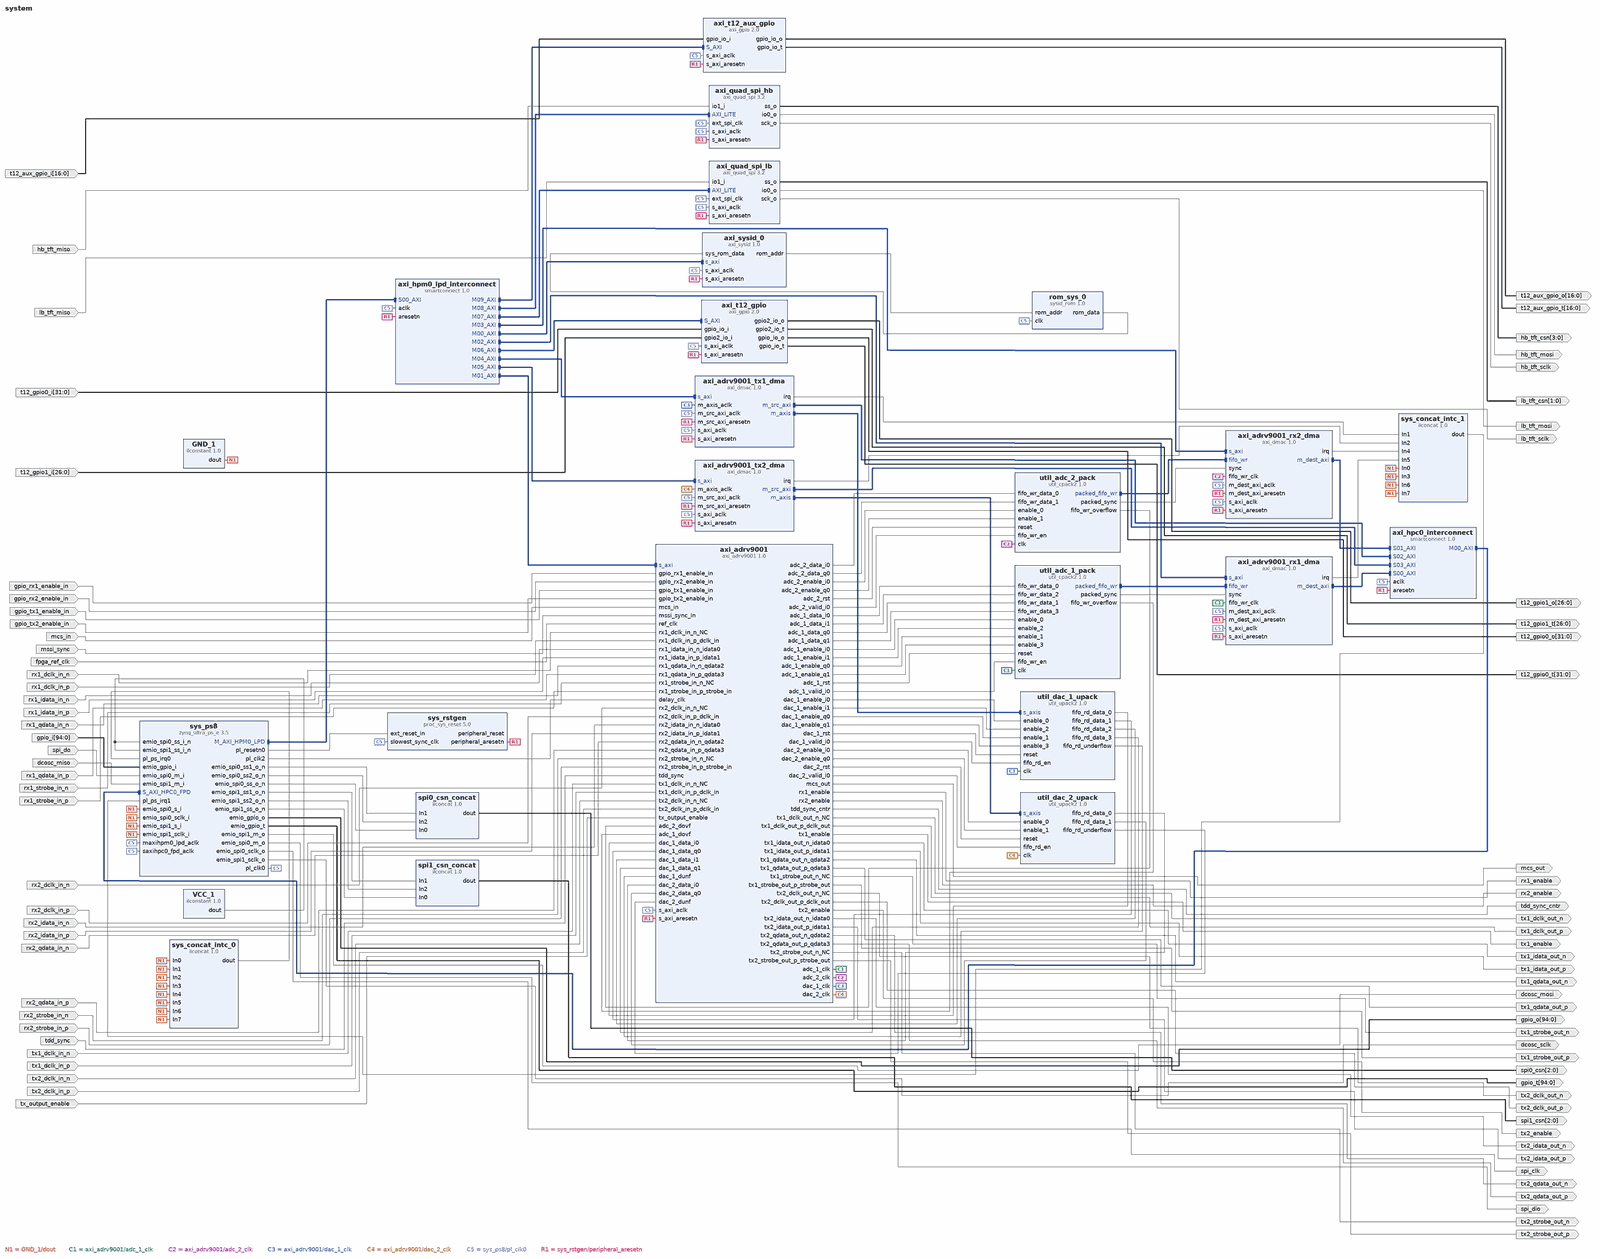
[diagram p0: block diagram of the top level, whole]
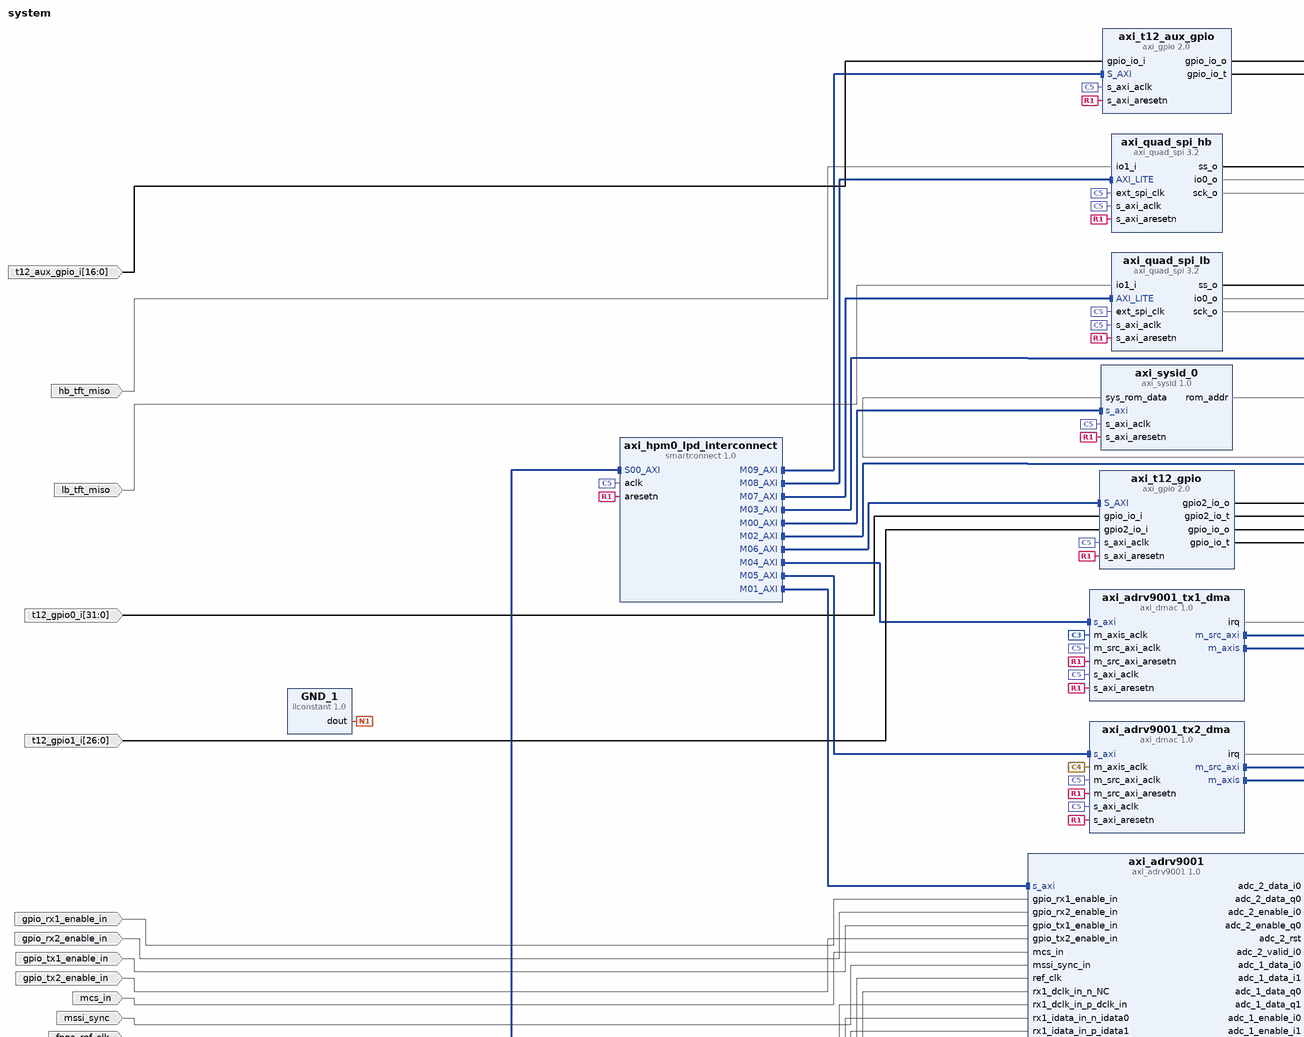
[diagram p1: block diagram of the top level, upper left part]
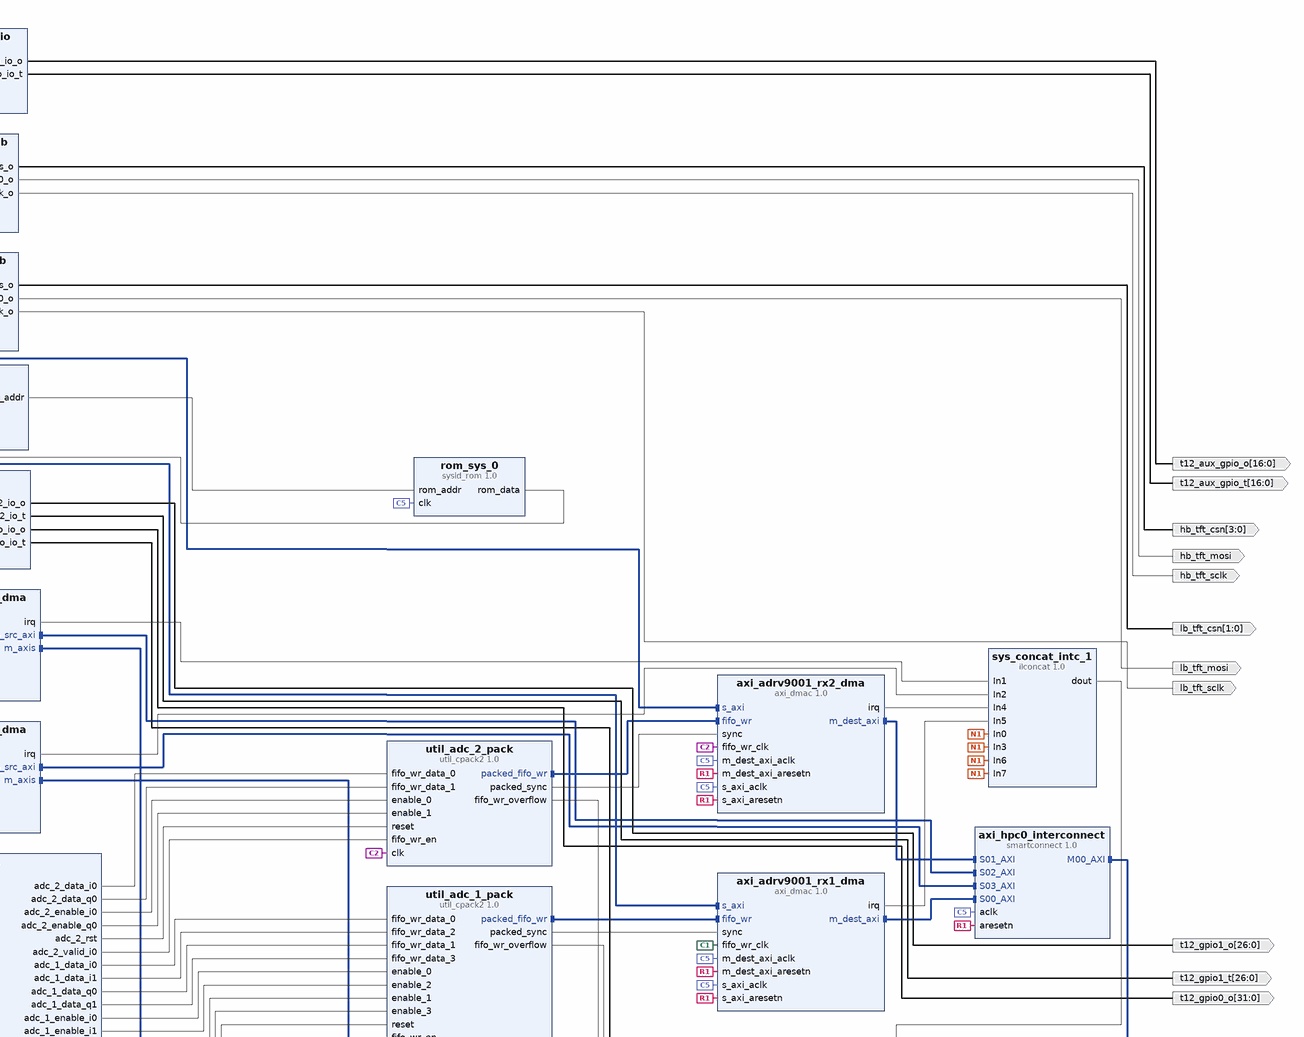
[diagram p2: block diagram of the top level, upper right part]
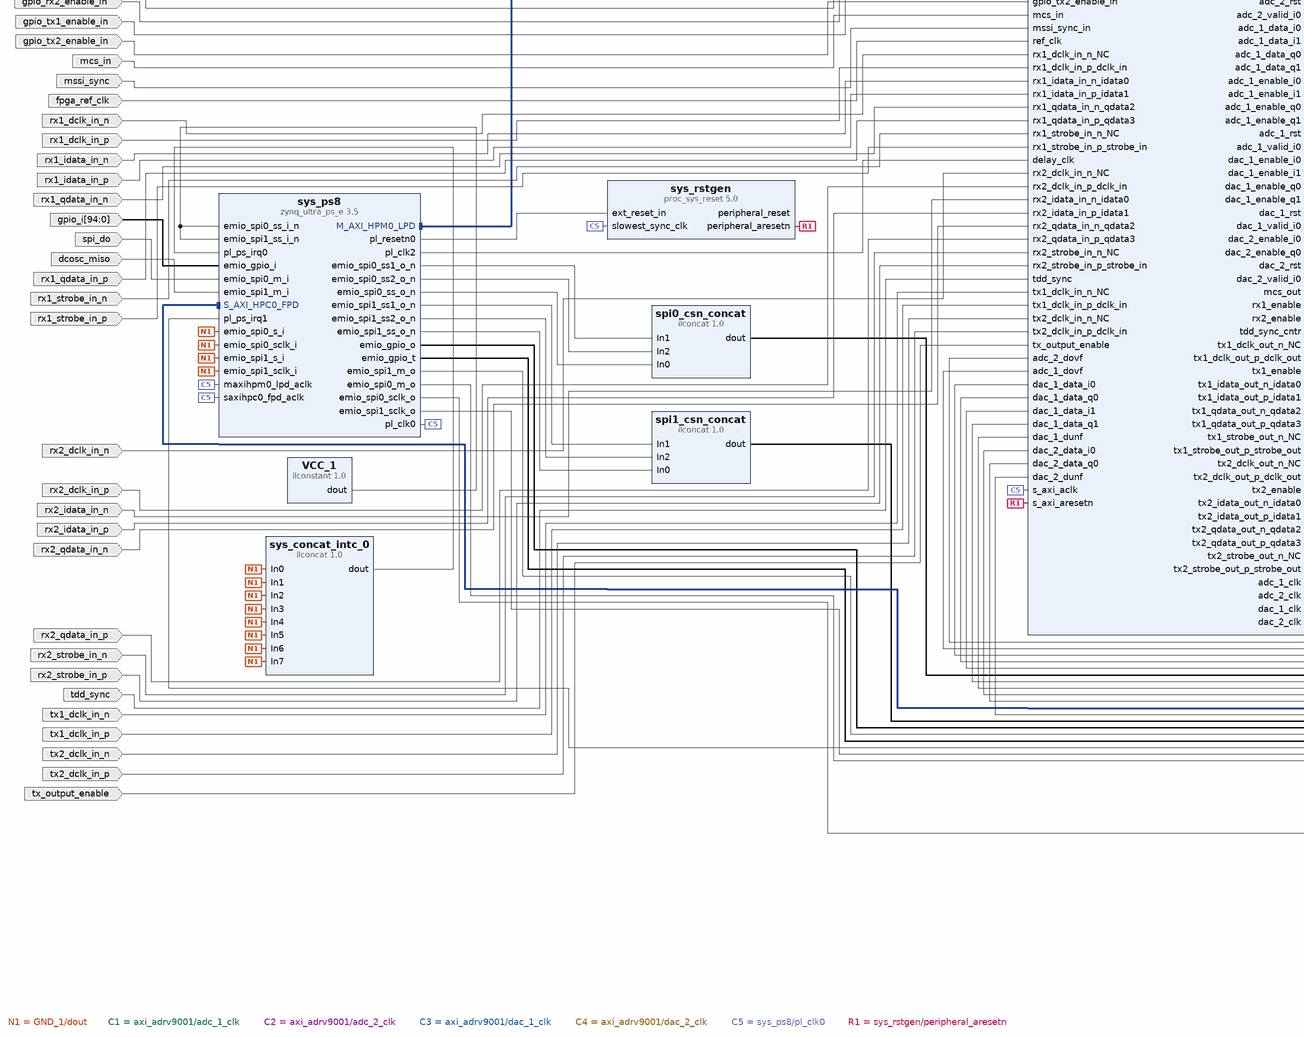
[diagram p3: block diagram of the top level, lower left part]
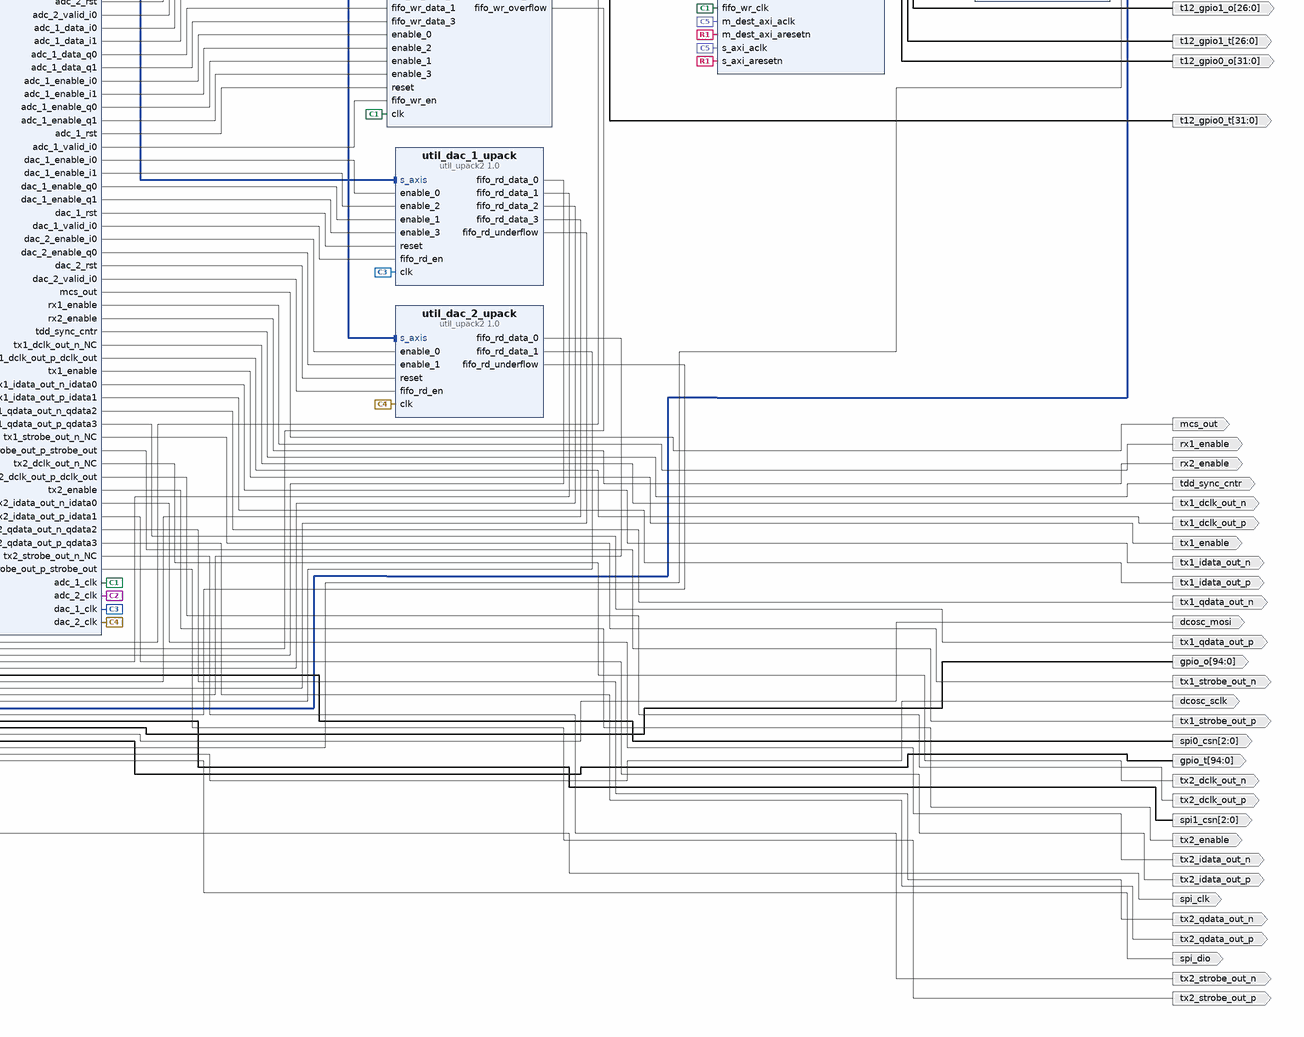
[diagram p4: block diagram of the top level, lower right part]
# Vivado block design system, xczu15eg-ffvb1156-2-i, Vivado 2024.1
create_bd_design system

create_bd_port -dir O -from 2 -to 0 spi0_csn
create_bd_port -dir O spi_clk
create_bd_port -dir O spi_dio
create_bd_port -dir I spi_do
create_bd_port -dir O -from 2 -to 0 spi1_csn
create_bd_port -dir O dcosc_sclk
create_bd_port -dir O dcosc_mosi
create_bd_port -dir I dcosc_miso
create_bd_port -dir I -from 16 -to 0 t12_aux_gpio_i
create_bd_port -dir O -from 16 -to 0 t12_aux_gpio_o
create_bd_port -dir O -from 16 -to 0 t12_aux_gpio_t
create_bd_port -dir O lb_tft_sclk
create_bd_port -dir O lb_tft_mosi
create_bd_port -dir I lb_tft_miso
create_bd_port -dir O -from 1 -to 0 lb_tft_csn
create_bd_port -dir O hb_tft_sclk
create_bd_port -dir O hb_tft_mosi
create_bd_port -dir I hb_tft_miso
create_bd_port -dir O -from 3 -to 0 hb_tft_csn
create_bd_port -dir I -from 94 -to 0 gpio_i
create_bd_port -dir O -from 94 -to 0 gpio_o
create_bd_port -dir O -from 94 -to 0 gpio_t
create_bd_port -dir I tx_output_enable
create_bd_port -dir I fpga_ref_clk
create_bd_port -dir I mcs_in
create_bd_port -dir O mcs_out
create_bd_port -dir I mssi_sync
create_bd_port -dir I rx1_dclk_in_n
create_bd_port -dir I rx1_dclk_in_p
create_bd_port -dir I rx1_idata_in_n
create_bd_port -dir I rx1_idata_in_p
create_bd_port -dir I rx1_qdata_in_n
create_bd_port -dir I rx1_qdata_in_p
create_bd_port -dir I rx1_strobe_in_n
create_bd_port -dir I rx1_strobe_in_p
create_bd_port -dir I rx2_dclk_in_n
create_bd_port -dir I rx2_dclk_in_p
create_bd_port -dir I rx2_idata_in_n
create_bd_port -dir I rx2_idata_in_p
create_bd_port -dir I rx2_qdata_in_n
create_bd_port -dir I rx2_qdata_in_p
create_bd_port -dir I rx2_strobe_in_n
create_bd_port -dir I rx2_strobe_in_p
create_bd_port -dir O tx1_dclk_out_n
create_bd_port -dir O tx1_dclk_out_p
create_bd_port -dir I tx1_dclk_in_n
create_bd_port -dir I tx1_dclk_in_p
create_bd_port -dir O tx1_idata_out_n
create_bd_port -dir O tx1_idata_out_p
create_bd_port -dir O tx1_qdata_out_n
create_bd_port -dir O tx1_qdata_out_p
create_bd_port -dir O tx1_strobe_out_n
create_bd_port -dir O tx1_strobe_out_p
create_bd_port -dir O tx2_dclk_out_n
create_bd_port -dir O tx2_dclk_out_p
create_bd_port -dir I tx2_dclk_in_n
create_bd_port -dir I tx2_dclk_in_p
create_bd_port -dir O tx2_idata_out_n
create_bd_port -dir O tx2_idata_out_p
create_bd_port -dir O tx2_qdata_out_n
create_bd_port -dir O tx2_qdata_out_p
create_bd_port -dir O tx2_strobe_out_n
create_bd_port -dir O tx2_strobe_out_p
create_bd_port -dir O rx1_enable
create_bd_port -dir O rx2_enable
create_bd_port -dir O tx1_enable
create_bd_port -dir O tx2_enable
create_bd_port -dir I gpio_rx1_enable_in
create_bd_port -dir I gpio_rx2_enable_in
create_bd_port -dir I gpio_tx1_enable_in
create_bd_port -dir I gpio_tx2_enable_in
create_bd_port -dir I tdd_sync
create_bd_port -dir O tdd_sync_cntr
create_bd_port -dir I -from 31 -to 0 t12_gpio0_i
create_bd_port -dir O -from 31 -to 0 t12_gpio0_o
create_bd_port -dir O -from 31 -to 0 t12_gpio0_t
create_bd_port -dir I -from 26 -to 0 t12_gpio1_i
create_bd_port -dir O -from 26 -to 0 t12_gpio1_o
create_bd_port -dir O -from 26 -to 0 t12_gpio1_t

create_bd_cell -type ip -vlnv xilinx.com:ip:zynq_ultra_ps_e:3.5 sys_ps8
set_property -dict [list \
  CONFIG.PSU_BANK_0_IO_STANDARD LVCMOS33 \
  CONFIG.PSU_BANK_1_IO_STANDARD LVCMOS33 \
  CONFIG.PSU_BANK_2_IO_STANDARD LVCMOS33 \
  CONFIG.PSU_BANK_3_IO_STANDARD LVCMOS33 \
  CONFIG.PSU_USB3__DUAL_CLOCK_ENABLE 0 \
  CONFIG.PSU__AFI0_COHERENCY 1 \
  CONFIG.PSU__CAN1__PERIPHERAL__ENABLE 0 \
  CONFIG.PSU__CRF_APB__ACPU_CTRL__FREQMHZ 1200 \
  CONFIG.PSU__CRF_APB__ACPU_CTRL__SRCSEL APLL \
  CONFIG.PSU__CRF_APB__APLL_CTRL__SRCSEL PSS_REF_CLK \
  CONFIG.PSU__CRF_APB__DBG_FPD_CTRL__FREQMHZ 250 \
  CONFIG.PSU__CRF_APB__DBG_FPD_CTRL__SRCSEL IOPLL \
  CONFIG.PSU__CRF_APB__DBG_TRACE_CTRL__FREQMHZ 250 \
  CONFIG.PSU__CRF_APB__DBG_TRACE_CTRL__SRCSEL IOPLL \
  CONFIG.PSU__CRF_APB__DBG_TSTMP_CTRL__FREQMHZ 250 \
  CONFIG.PSU__CRF_APB__DBG_TSTMP_CTRL__SRCSEL IOPLL \
  CONFIG.PSU__CRF_APB__DDR_CTRL__FREQMHZ 1200 \
  CONFIG.PSU__CRF_APB__DDR_CTRL__SRCSEL VPLL \
  CONFIG.PSU__CRF_APB__DPDMA_REF_CTRL__FREQMHZ 600 \
  CONFIG.PSU__CRF_APB__DPDMA_REF_CTRL__SRCSEL APLL \
  CONFIG.PSU__CRF_APB__DPLL_CTRL__SRCSEL PSS_REF_CLK \
  CONFIG.PSU__CRF_APB__DP_AUDIO_REF_CTRL__SRCSEL RPLL \
  CONFIG.PSU__CRF_APB__DP_STC_REF_CTRL__SRCSEL RPLL \
  CONFIG.PSU__CRF_APB__DP_VIDEO_REF_CTRL__SRCSEL VPLL \
  CONFIG.PSU__CRF_APB__GDMA_REF_CTRL__FREQMHZ 600 \
  CONFIG.PSU__CRF_APB__GDMA_REF_CTRL__SRCSEL APLL \
  CONFIG.PSU__CRF_APB__GPU_REF_CTRL__FREQMHZ 500 \
  CONFIG.PSU__CRF_APB__GPU_REF_CTRL__SRCSEL IOPLL \
  CONFIG.PSU__CRF_APB__TOPSW_LSBUS_CTRL__FREQMHZ 100 \
  CONFIG.PSU__CRF_APB__TOPSW_LSBUS_CTRL__SRCSEL IOPLL \
  CONFIG.PSU__CRF_APB__TOPSW_MAIN_CTRL__FREQMHZ 533.33 \
  CONFIG.PSU__CRF_APB__TOPSW_MAIN_CTRL__SRCSEL DPLL \
  CONFIG.PSU__CRF_APB__VPLL_CTRL__SRCSEL PSS_REF_CLK \
  CONFIG.PSU__CRL_APB__ADMA_REF_CTRL__FREQMHZ 500 \
  CONFIG.PSU__CRL_APB__ADMA_REF_CTRL__SRCSEL IOPLL \
  CONFIG.PSU__CRL_APB__CAN1_REF_CTRL__FREQMHZ 100 \
  CONFIG.PSU__CRL_APB__CAN1_REF_CTRL__SRCSEL IOPLL \
  CONFIG.PSU__CRL_APB__CPU_R5_CTRL__FREQMHZ 500 \
  CONFIG.PSU__CRL_APB__CPU_R5_CTRL__SRCSEL IOPLL \
  CONFIG.PSU__CRL_APB__DBG_LPD_CTRL__FREQMHZ 250 \
  CONFIG.PSU__CRL_APB__DBG_LPD_CTRL__SRCSEL IOPLL \
  CONFIG.PSU__CRL_APB__GEM3_REF_CTRL__FREQMHZ 125 \
  CONFIG.PSU__CRL_APB__GEM3_REF_CTRL__SRCSEL IOPLL \
  CONFIG.PSU__CRL_APB__I2C0_REF_CTRL__FREQMHZ 100 \
  CONFIG.PSU__CRL_APB__I2C0_REF_CTRL__SRCSEL IOPLL \
  CONFIG.PSU__CRL_APB__I2C1_REF_CTRL__FREQMHZ 100 \
  CONFIG.PSU__CRL_APB__I2C1_REF_CTRL__SRCSEL IOPLL \
  CONFIG.PSU__CRL_APB__IOPLL_CTRL__SRCSEL PSS_REF_CLK \
  CONFIG.PSU__CRL_APB__IOU_SWITCH_CTRL__FREQMHZ 250 \
  CONFIG.PSU__CRL_APB__IOU_SWITCH_CTRL__SRCSEL IOPLL \
  CONFIG.PSU__CRL_APB__LPD_LSBUS_CTRL__FREQMHZ 100 \
  CONFIG.PSU__CRL_APB__LPD_LSBUS_CTRL__SRCSEL IOPLL \
  CONFIG.PSU__CRL_APB__LPD_SWITCH_CTRL__FREQMHZ 500 \
  CONFIG.PSU__CRL_APB__LPD_SWITCH_CTRL__SRCSEL IOPLL \
  CONFIG.PSU__CRL_APB__PCAP_CTRL__FREQMHZ 200 \
  CONFIG.PSU__CRL_APB__PCAP_CTRL__SRCSEL IOPLL \
  CONFIG.PSU__CRL_APB__PL0_REF_CTRL__FREQMHZ 100 \
  CONFIG.PSU__CRL_APB__PL0_REF_CTRL__SRCSEL IOPLL \
  CONFIG.PSU__CRL_APB__PL1_REF_CTRL__FREQMHZ 250 \
  CONFIG.PSU__CRL_APB__PL1_REF_CTRL__SRCSEL IOPLL \
  CONFIG.PSU__CRL_APB__PL2_REF_CTRL__FREQMHZ 500 \
  CONFIG.PSU__CRL_APB__PL2_REF_CTRL__SRCSEL IOPLL \
  CONFIG.PSU__CRL_APB__QSPI_REF_CTRL__FREQMHZ 125 \
  CONFIG.PSU__CRL_APB__QSPI_REF_CTRL__SRCSEL IOPLL \
  CONFIG.PSU__CRL_APB__RPLL_CTRL__SRCSEL PSS_REF_CLK \
  CONFIG.PSU__CRL_APB__SDIO1_REF_CTRL__FREQMHZ 200 \
  CONFIG.PSU__CRL_APB__SDIO1_REF_CTRL__SRCSEL IOPLL \
  CONFIG.PSU__CRL_APB__SPI0_REF_CTRL__FREQMHZ 100 \
  CONFIG.PSU__CRL_APB__SPI1_REF_CTRL__FREQMHZ 100 \
  CONFIG.PSU__CRL_APB__TIMESTAMP_REF_CTRL__FREQMHZ 100 \
  CONFIG.PSU__CRL_APB__TIMESTAMP_REF_CTRL__SRCSEL IOPLL \
  CONFIG.PSU__CRL_APB__UART0_REF_CTRL__FREQMHZ 100 \
  CONFIG.PSU__CRL_APB__UART0_REF_CTRL__SRCSEL IOPLL \
  CONFIG.PSU__CRL_APB__UART1_REF_CTRL__FREQMHZ 100 \
  CONFIG.PSU__CRL_APB__UART1_REF_CTRL__SRCSEL IOPLL \
  CONFIG.PSU__CRL_APB__USB0_BUS_REF_CTRL__FREQMHZ 250 \
  CONFIG.PSU__CRL_APB__USB0_BUS_REF_CTRL__SRCSEL IOPLL \
  CONFIG.PSU__CRL_APB__USB3_DUAL_REF_CTRL__FREQMHZ 20 \
  CONFIG.PSU__CRL_APB__USB3_DUAL_REF_CTRL__SRCSEL IOPLL \
  CONFIG.PSU__CRL_APB__USB3__ENABLE 0 \
  CONFIG.PSU__CSUPMU__PERIPHERAL__VALID 1 \
  CONFIG.PSU__DDRC__BUS_WIDTH {32 Bit} \
  CONFIG.PSU__DDRC__COMPONENTS Components \
  CONFIG.PSU__DDRC__DEVICE_CAPACITY {8192 MBits} \
  CONFIG.PSU__DDRC__DRAM_WIDTH {16 Bits} \
  CONFIG.PSU__DDRC__ECC Disabled \
  CONFIG.PSU__DDRC__MEMORY_TYPE {DDR 4} \
  CONFIG.PSU__DDRC__SPEED_BIN DDR4_2400T \
  CONFIG.PSU__DDR_HIGH_ADDRESS_GUI_ENABLE 0 \
  CONFIG.PSU__DDR__INTERFACE__FREQMHZ 600.000 \
  CONFIG.PSU__DISPLAYPORT__PERIPHERAL__ENABLE 0 \
  CONFIG.PSU__DLL__ISUSED 0 \
  CONFIG.PSU__ENET3__FIFO__ENABLE 0 \
  CONFIG.PSU__ENET3__GRP_MDIO__ENABLE 1 \
  CONFIG.PSU__ENET3__GRP_MDIO__IO {MIO 76 .. 77} \
  CONFIG.PSU__ENET3__PERIPHERAL__ENABLE 1 \
  CONFIG.PSU__ENET3__PERIPHERAL__IO {MIO 64 .. 75} \
  CONFIG.PSU__ENET3__PTP__ENABLE 0 \
  CONFIG.PSU__ENET3__TSU__ENABLE 0 \
  CONFIG.PSU__FPGA_PL0_ENABLE 1 \
  CONFIG.PSU__FPGA_PL1_ENABLE 1 \
  CONFIG.PSU__FPGA_PL2_ENABLE 1 \
  CONFIG.PSU__GEM3_COHERENCY 0 \
  CONFIG.PSU__GEM3_ROUTE_THROUGH_FPD 0 \
  CONFIG.PSU__GEM__TSU__ENABLE 0 \
  CONFIG.PSU__GPIO0_MIO__IO {MIO 0 .. 25} \
  CONFIG.PSU__GPIO0_MIO__PERIPHERAL__ENABLE 1 \
  CONFIG.PSU__GPIO1_MIO__IO {MIO 26 .. 51} \
  CONFIG.PSU__GPIO1_MIO__PERIPHERAL__ENABLE 1 \
  CONFIG.PSU__GPIO_EMIO_WIDTH 95 \
  CONFIG.PSU__GPIO_EMIO__PERIPHERAL__ENABLE 1 \
  CONFIG.PSU__GPIO_EMIO__PERIPHERAL__IO 95 \
  CONFIG.PSU__I2C0__PERIPHERAL__ENABLE 1 \
  CONFIG.PSU__I2C0__PERIPHERAL__IO {MIO 42 .. 43} \
  CONFIG.PSU__I2C1__PERIPHERAL__ENABLE 0 \
  CONFIG.PSU__IOU_SLCR__IOU_TTC_APB_CLK__TTC0_SEL APB \
  CONFIG.PSU__IOU_SLCR__IOU_TTC_APB_CLK__TTC1_SEL APB \
  CONFIG.PSU__IOU_SLCR__IOU_TTC_APB_CLK__TTC2_SEL APB \
  CONFIG.PSU__IOU_SLCR__IOU_TTC_APB_CLK__TTC3_SEL APB \
  CONFIG.PSU__OVERRIDE__BASIC_CLOCK 0 \
  CONFIG.PSU__PCIE__CLASS_CODE_BASE 0x06 \
  CONFIG.PSU__PCIE__CLASS_CODE_INTERFACE 0x0 \
  CONFIG.PSU__PCIE__CLASS_CODE_SUB 0x4 \
  CONFIG.PSU__PCIE__DEVICE_ID 0xD021 \
  CONFIG.PSU__PCIE__REVISION_ID 0x0 \
  CONFIG.PSU__PCIE__SUBSYSTEM_ID 0x7 \
  CONFIG.PSU__PCIE__SUBSYSTEM_VENDOR_ID 0x10EE \
  CONFIG.PSU__PCIE__VENDOR_ID 0x10EE \
  CONFIG.PSU__PMU_COHERENCY 0 \
  CONFIG.PSU__PMU__AIBACK__ENABLE 0 \
  CONFIG.PSU__PMU__EMIO_GPI__ENABLE 0 \
  CONFIG.PSU__PMU__EMIO_GPO__ENABLE 0 \
  CONFIG.PSU__PMU__GPI0__ENABLE 0 \
  CONFIG.PSU__PMU__GPI1__ENABLE 0 \
  CONFIG.PSU__PMU__GPI2__ENABLE 0 \
  CONFIG.PSU__PMU__GPI3__ENABLE 0 \
  CONFIG.PSU__PMU__GPI4__ENABLE 0 \
  CONFIG.PSU__PMU__GPI5__ENABLE 0 \
  CONFIG.PSU__PMU__GPO0__ENABLE 1 \
  CONFIG.PSU__PMU__GPO0__IO {MIO 32} \
  CONFIG.PSU__PMU__GPO1__ENABLE 1 \
  CONFIG.PSU__PMU__GPO1__IO {MIO 33} \
  CONFIG.PSU__PMU__GPO2__ENABLE 0 \
  CONFIG.PSU__PMU__GPO3__ENABLE 0 \
  CONFIG.PSU__PMU__GPO4__ENABLE 0 \
  CONFIG.PSU__PMU__GPO5__ENABLE 1 \
  CONFIG.PSU__PMU__GPO5__IO {MIO 37} \
  CONFIG.PSU__PMU__GPO5__POLARITY low \
  CONFIG.PSU__PMU__PERIPHERAL__ENABLE 1 \
  CONFIG.PSU__PMU__PLERROR__ENABLE 0 \
  CONFIG.PSU__PRESET_APPLIED 1 \
  CONFIG.PSU__PSS_REF_CLK__FREQMHZ 33.333333333 \
  CONFIG.PSU__QSPI_COHERENCY 0 \
  CONFIG.PSU__QSPI_ROUTE_THROUGH_FPD 0 \
  CONFIG.PSU__QSPI__GRP_FBCLK__ENABLE 0 \
  CONFIG.PSU__QSPI__PERIPHERAL__DATA_MODE x4 \
  CONFIG.PSU__QSPI__PERIPHERAL__ENABLE 1 \
  CONFIG.PSU__QSPI__PERIPHERAL__IO {MIO 0 .. 5} \
  CONFIG.PSU__QSPI__PERIPHERAL__MODE Single \
  CONFIG.PSU__SATA__PERIPHERAL__ENABLE 0 \
  CONFIG.PSU__SD1__CLK_100_SDR_OTAP_DLY 0x3 \
  CONFIG.PSU__SD1__CLK_200_SDR_OTAP_DLY 0x3 \
  CONFIG.PSU__SD1__CLK_50_DDR_ITAP_DLY 0x3D \
  CONFIG.PSU__SD1__CLK_50_DDR_OTAP_DLY 0x4 \
  CONFIG.PSU__SD1__CLK_50_SDR_ITAP_DLY 0x15 \
  CONFIG.PSU__SD1__CLK_50_SDR_OTAP_DLY 0x5 \
  CONFIG.PSU__SD1__PERIPHERAL__ENABLE 0 \
  CONFIG.PSU__SPI0__GRP_SS0__IO EMIO \
  CONFIG.PSU__SPI0__GRP_SS1__ENABLE 1 \
  CONFIG.PSU__SPI0__GRP_SS1__IO EMIO \
  CONFIG.PSU__SPI0__GRP_SS2__ENABLE 1 \
  CONFIG.PSU__SPI0__GRP_SS2__IO EMIO \
  CONFIG.PSU__SPI0__PERIPHERAL__ENABLE 1 \
  CONFIG.PSU__SPI0__PERIPHERAL__IO EMIO \
  CONFIG.PSU__SPI1__GRP_SS0__IO EMIO \
  CONFIG.PSU__SPI1__GRP_SS1__ENABLE 1 \
  CONFIG.PSU__SPI1__GRP_SS1__IO EMIO \
  CONFIG.PSU__SPI1__GRP_SS2__ENABLE 1 \
  CONFIG.PSU__SPI1__GRP_SS2__IO EMIO \
  CONFIG.PSU__SPI1__PERIPHERAL__ENABLE 1 \
  CONFIG.PSU__SPI1__PERIPHERAL__IO EMIO \
  CONFIG.PSU__SWDT0__CLOCK__ENABLE 0 \
  CONFIG.PSU__SWDT0__PERIPHERAL__ENABLE 1 \
  CONFIG.PSU__SWDT0__RESET__ENABLE 0 \
  CONFIG.PSU__SWDT1__CLOCK__ENABLE 0 \
  CONFIG.PSU__SWDT1__PERIPHERAL__ENABLE 1 \
  CONFIG.PSU__SWDT1__RESET__ENABLE 0 \
  CONFIG.PSU__TSU__BUFG_PORT_PAIR 0 \
  CONFIG.PSU__TTC0__CLOCK__ENABLE 0 \
  CONFIG.PSU__TTC0__PERIPHERAL__ENABLE 1 \
  CONFIG.PSU__TTC0__WAVEOUT__ENABLE 0 \
  CONFIG.PSU__TTC1__CLOCK__ENABLE 0 \
  CONFIG.PSU__TTC1__PERIPHERAL__ENABLE 1 \
  CONFIG.PSU__TTC1__WAVEOUT__ENABLE 0 \
  CONFIG.PSU__TTC2__CLOCK__ENABLE 0 \
  CONFIG.PSU__TTC2__PERIPHERAL__ENABLE 1 \
  CONFIG.PSU__TTC2__WAVEOUT__ENABLE 0 \
  CONFIG.PSU__TTC3__CLOCK__ENABLE 0 \
  CONFIG.PSU__TTC3__PERIPHERAL__ENABLE 1 \
  CONFIG.PSU__TTC3__WAVEOUT__ENABLE 0 \
  CONFIG.PSU__UART0__BAUD_RATE 115200 \
  CONFIG.PSU__UART0__MODEM__ENABLE 0 \
  CONFIG.PSU__UART0__PERIPHERAL__ENABLE 1 \
  CONFIG.PSU__UART0__PERIPHERAL__IO {MIO 26 .. 27} \
  CONFIG.PSU__UART1__PERIPHERAL__ENABLE 0 \
  CONFIG.PSU__USB0__PERIPHERAL__ENABLE 0 \
  CONFIG.PSU__USE__IRQ0 1 \
  CONFIG.PSU__USE__IRQ1 1 \
  CONFIG.PSU__USE__M_AXI_GP0 0 \
  CONFIG.PSU__USE__M_AXI_GP1 0 \
  CONFIG.PSU__USE__M_AXI_GP2 1 \
  CONFIG.PSU__USE__S_AXI_GP0 1 \
] [get_bd_cells sys_ps8]
# 188 more settings of sys_ps8 are not shown: defaults, MIO pin electricals, DDR timing, and values the tool derives
create_bd_cell -type ip -vlnv xilinx.com:ip:proc_sys_reset:5.0 sys_rstgen
set_property -dict {CONFIG.C_EXT_RST_WIDTH 1} [get_bd_cells sys_rstgen]
create_bd_cell -type inline_hdl -vlnv xilinx.com:inline_hdl:ilconcat:1.0 spi0_csn_concat
set_property -dict {CONFIG.NUM_PORTS 3} [get_bd_cells spi0_csn_concat]
create_bd_cell -type inline_hdl -vlnv xilinx.com:inline_hdl:ilconstant:1.0 VCC_1
set_property -dict {CONFIG.CONST_VAL 1 CONFIG.CONST_WIDTH 1} [get_bd_cells VCC_1]
create_bd_cell -type inline_hdl -vlnv xilinx.com:inline_hdl:ilconstant:1.0 GND_1
set_property -dict {CONFIG.CONST_VAL 0 CONFIG.CONST_WIDTH 1} [get_bd_cells GND_1]
create_bd_cell -type inline_hdl -vlnv xilinx.com:inline_hdl:ilconcat:1.0 spi1_csn_concat
set_property -dict {CONFIG.NUM_PORTS 3} [get_bd_cells spi1_csn_concat]
create_bd_cell -type ip -vlnv analog.com:user:axi_sysid:1.0 axi_sysid_0
set_property -dict {CONFIG.ROM_ADDR_BITS 9} [get_bd_cells axi_sysid_0]
create_bd_cell -type ip -vlnv analog.com:user:sysid_rom:1.0 rom_sys_0
set_property -dict [list \
  CONFIG.PATH_TO_FILE /home/taokhe/Projects/in/msdr/msdr_gen/mem_init_sys.txt \
  CONFIG.ROM_ADDR_BITS 9 \
] [get_bd_cells rom_sys_0]
create_bd_cell -type ip -vlnv xilinx.com:ip:smartconnect:1.0 axi_hpm0_lpd_interconnect
set_property -dict {CONFIG.NUM_MI 10 CONFIG.NUM_SI 1} [get_bd_cells axi_hpm0_lpd_interconnect]
create_bd_cell -type inline_hdl -vlnv xilinx.com:inline_hdl:ilconcat:1.0 sys_concat_intc_0
set_property -dict {CONFIG.NUM_PORTS 8} [get_bd_cells sys_concat_intc_0]
create_bd_cell -type inline_hdl -vlnv xilinx.com:inline_hdl:ilconcat:1.0 sys_concat_intc_1
set_property -dict {CONFIG.NUM_PORTS 8} [get_bd_cells sys_concat_intc_1]
create_bd_cell -type ip -vlnv analog.com:user:axi_adrv9001:1.0 axi_adrv9001
set_property -dict {CONFIG.CMOS_LVDS_N 0 CONFIG.USE_RX_CLK_FOR_TX1 2 CONFIG.USE_RX_CLK_FOR_TX2 2} [get_bd_cells axi_adrv9001]
create_bd_cell -type ip -vlnv analog.com:user:axi_dmac:1.0 axi_adrv9001_rx1_dma
set_property -dict [list \
  CONFIG.ALLOW_ASYM_MEM 1 \
  CONFIG.AXI_SLICE_DEST false \
  CONFIG.AXI_SLICE_SRC false \
  CONFIG.CACHE_COHERENT true \
  CONFIG.CYCLIC false \
  CONFIG.DMA_2D_TRANSFER false \
  CONFIG.DMA_DATA_WIDTH_SRC 64 \
  CONFIG.DMA_TYPE_DEST 0 \
  CONFIG.DMA_TYPE_SRC 2 \
  CONFIG.SYNC_TRANSFER_START true \
] [get_bd_cells axi_adrv9001_rx1_dma]
create_bd_cell -type ip -vlnv analog.com:user:util_cpack2:1.0 util_adc_1_pack
set_property -dict {CONFIG.NUM_OF_CHANNELS 4 CONFIG.SAMPLE_DATA_WIDTH 16} [get_bd_cells util_adc_1_pack]
create_bd_cell -type ip -vlnv analog.com:user:axi_dmac:1.0 axi_adrv9001_rx2_dma
set_property -dict [list \
  CONFIG.ALLOW_ASYM_MEM 1 \
  CONFIG.AXI_SLICE_DEST false \
  CONFIG.AXI_SLICE_SRC false \
  CONFIG.CACHE_COHERENT true \
  CONFIG.CYCLIC false \
  CONFIG.DMA_2D_TRANSFER false \
  CONFIG.DMA_DATA_WIDTH_SRC 32 \
  CONFIG.DMA_TYPE_DEST 0 \
  CONFIG.DMA_TYPE_SRC 2 \
  CONFIG.SYNC_TRANSFER_START true \
] [get_bd_cells axi_adrv9001_rx2_dma]
create_bd_cell -type ip -vlnv analog.com:user:util_cpack2:1.0 util_adc_2_pack
set_property -dict {CONFIG.NUM_OF_CHANNELS 2 CONFIG.SAMPLE_DATA_WIDTH 16} [get_bd_cells util_adc_2_pack]
create_bd_cell -type ip -vlnv analog.com:user:axi_dmac:1.0 axi_adrv9001_tx1_dma
set_property -dict [list \
  CONFIG.ALLOW_ASYM_MEM 1 \
  CONFIG.AXI_SLICE_DEST false \
  CONFIG.AXI_SLICE_SRC false \
  CONFIG.CACHE_COHERENT true \
  CONFIG.CYCLIC true \
  CONFIG.DMA_2D_TRANSFER false \
  CONFIG.DMA_DATA_WIDTH_DEST 64 \
  CONFIG.DMA_TYPE_DEST 1 \
  CONFIG.DMA_TYPE_SRC 0 \
  CONFIG.SYNC_TRANSFER_START false \
] [get_bd_cells axi_adrv9001_tx1_dma]
create_bd_cell -type ip -vlnv analog.com:user:util_upack2:1.0 util_dac_1_upack
set_property -dict {CONFIG.NUM_OF_CHANNELS 4 CONFIG.SAMPLE_DATA_WIDTH 16} [get_bd_cells util_dac_1_upack]
create_bd_cell -type ip -vlnv analog.com:user:axi_dmac:1.0 axi_adrv9001_tx2_dma
set_property -dict [list \
  CONFIG.ALLOW_ASYM_MEM 1 \
  CONFIG.AXI_SLICE_DEST false \
  CONFIG.AXI_SLICE_SRC false \
  CONFIG.CACHE_COHERENT true \
  CONFIG.CYCLIC true \
  CONFIG.DMA_2D_TRANSFER false \
  CONFIG.DMA_DATA_WIDTH_DEST 32 \
  CONFIG.DMA_TYPE_DEST 1 \
  CONFIG.DMA_TYPE_SRC 0 \
  CONFIG.SYNC_TRANSFER_START false \
] [get_bd_cells axi_adrv9001_tx2_dma]
create_bd_cell -type ip -vlnv analog.com:user:util_upack2:1.0 util_dac_2_upack
set_property -dict {CONFIG.NUM_OF_CHANNELS 2 CONFIG.SAMPLE_DATA_WIDTH 16} [get_bd_cells util_dac_2_upack]
create_bd_cell -type ip -vlnv xilinx.com:ip:smartconnect:1.0 axi_hpc0_interconnect
set_property -dict {CONFIG.NUM_MI 1 CONFIG.NUM_SI 4} [get_bd_cells axi_hpc0_interconnect]
create_bd_cell -type ip -vlnv xilinx.com:ip:axi_gpio:2.0 axi_t12_gpio
set_property -dict [list \
  CONFIG.C_ALL_INPUTS 0 \
  CONFIG.C_ALL_INPUTS_2 0 \
  CONFIG.C_ALL_OUTPUTS 0 \
  CONFIG.C_ALL_OUTPUTS_2 0 \
  CONFIG.C_DOUT_DEFAULT 0x00000000 \
  CONFIG.C_DOUT_DEFAULT_2 0x00000000 \
  CONFIG.C_GPIO2_WIDTH 27 \
  CONFIG.C_GPIO_WIDTH 32 \
  CONFIG.C_INTERRUPT_PRESENT 0 \
  CONFIG.C_IS_DUAL 1 \
  CONFIG.C_TRI_DEFAULT 0xFFFFFFFF \
  CONFIG.C_TRI_DEFAULT_2 0xFFFFFFFF \
] [get_bd_cells axi_t12_gpio]
create_bd_cell -type ip -vlnv xilinx.com:ip:axi_gpio:2.0 axi_t12_aux_gpio
set_property -dict [list \
  CONFIG.C_ALL_INPUTS 0 \
  CONFIG.C_ALL_OUTPUTS 0 \
  CONFIG.C_DOUT_DEFAULT 0x00000000 \
  CONFIG.C_GPIO_WIDTH 17 \
  CONFIG.C_INTERRUPT_PRESENT 0 \
  CONFIG.C_TRI_DEFAULT 0x0001FFFF \
] [get_bd_cells axi_t12_aux_gpio]
create_bd_cell -type ip -vlnv xilinx.com:ip:axi_quad_spi:3.2 axi_quad_spi_lb
set_property -dict [list \
  CONFIG.C_FIFO_DEPTH 16 \
  CONFIG.C_NUM_SS_BITS 2 \
  CONFIG.C_NUM_TRANSFER_BITS 8 \
  CONFIG.C_SCK_RATIO 16 \
  CONFIG.C_SPI_MODE 0 \
  CONFIG.C_USE_STARTUP 0 \
  CONFIG.FIFO_INCLUDED 1 \
  CONFIG.Master_mode 1 \
] [get_bd_cells axi_quad_spi_lb]
create_bd_cell -type ip -vlnv xilinx.com:ip:axi_quad_spi:3.2 axi_quad_spi_hb
set_property -dict [list \
  CONFIG.C_FIFO_DEPTH 16 \
  CONFIG.C_NUM_SS_BITS 4 \
  CONFIG.C_NUM_TRANSFER_BITS 8 \
  CONFIG.C_SCK_RATIO 16 \
  CONFIG.C_SPI_MODE 0 \
  CONFIG.C_USE_STARTUP 0 \
  CONFIG.FIFO_INCLUDED 1 \
  CONFIG.Master_mode 1 \
] [get_bd_cells axi_quad_spi_hb]

# ---- connections ----

connect_bd_intf_net [get_bd_intf_pins axi_hpc0_interconnect/S00_AXI] [get_bd_intf_pins axi_adrv9001_rx1_dma/m_dest_axi]
connect_bd_intf_net [get_bd_intf_pins axi_hpc0_interconnect/S01_AXI] [get_bd_intf_pins axi_adrv9001_rx2_dma/m_dest_axi]
connect_bd_intf_net [get_bd_intf_pins axi_adrv9001_tx1_dma/m_axis] [get_bd_intf_pins util_dac_1_upack/s_axis]
connect_bd_intf_net [get_bd_intf_pins axi_hpc0_interconnect/S02_AXI] [get_bd_intf_pins axi_adrv9001_tx1_dma/m_src_axi]
connect_bd_intf_net [get_bd_intf_pins axi_adrv9001_tx2_dma/m_axis] [get_bd_intf_pins util_dac_2_upack/s_axis]
connect_bd_intf_net [get_bd_intf_pins axi_hpc0_interconnect/S03_AXI] [get_bd_intf_pins axi_adrv9001_tx2_dma/m_src_axi]
connect_bd_intf_net [get_bd_intf_pins axi_hpc0_interconnect/M00_AXI] [get_bd_intf_pins sys_ps8/S_AXI_HPC0_FPD]
connect_bd_intf_net [get_bd_intf_pins axi_hpm0_lpd_interconnect/M00_AXI] [get_bd_intf_pins axi_sysid_0/s_axi]
connect_bd_intf_net [get_bd_intf_pins axi_hpm0_lpd_interconnect/M01_AXI] [get_bd_intf_pins axi_adrv9001/s_axi]
connect_bd_intf_net [get_bd_intf_pins axi_hpm0_lpd_interconnect/M02_AXI] [get_bd_intf_pins axi_adrv9001_rx1_dma/s_axi]
connect_bd_intf_net [get_bd_intf_pins axi_hpm0_lpd_interconnect/M03_AXI] [get_bd_intf_pins axi_adrv9001_rx2_dma/s_axi]
connect_bd_intf_net [get_bd_intf_pins axi_hpm0_lpd_interconnect/M04_AXI] [get_bd_intf_pins axi_adrv9001_tx1_dma/s_axi]
connect_bd_intf_net [get_bd_intf_pins axi_hpm0_lpd_interconnect/M05_AXI] [get_bd_intf_pins axi_adrv9001_tx2_dma/s_axi]
connect_bd_intf_net [get_bd_intf_pins axi_hpm0_lpd_interconnect/M06_AXI] [get_bd_intf_pins axi_t12_gpio/S_AXI]
connect_bd_intf_net [get_bd_intf_pins axi_hpm0_lpd_interconnect/M07_AXI] [get_bd_intf_pins axi_quad_spi_lb/AXI_LITE]
connect_bd_intf_net [get_bd_intf_pins axi_hpm0_lpd_interconnect/M08_AXI] [get_bd_intf_pins axi_quad_spi_hb/AXI_LITE]
connect_bd_intf_net [get_bd_intf_pins axi_hpm0_lpd_interconnect/M09_AXI] [get_bd_intf_pins axi_t12_aux_gpio/S_AXI]
connect_bd_intf_net [get_bd_intf_pins axi_hpm0_lpd_interconnect/S00_AXI] [get_bd_intf_pins sys_ps8/M_AXI_HPM0_LPD]
connect_bd_intf_net [get_bd_intf_pins util_adc_1_pack/packed_fifo_wr] [get_bd_intf_pins axi_adrv9001_rx1_dma/fifo_wr]
connect_bd_intf_net [get_bd_intf_pins util_adc_2_pack/packed_fifo_wr] [get_bd_intf_pins axi_adrv9001_rx2_dma/fifo_wr]
connect_bd_net [get_bd_pins GND_1/dout] \
  [get_bd_pins sys_concat_intc_1/In7] [get_bd_pins sys_concat_intc_1/In6] [get_bd_pins sys_concat_intc_1/In3] \
  [get_bd_pins sys_concat_intc_1/In0] [get_bd_pins sys_concat_intc_0/In7] [get_bd_pins sys_concat_intc_0/In6] \
  [get_bd_pins sys_concat_intc_0/In5] [get_bd_pins sys_concat_intc_0/In4] [get_bd_pins sys_concat_intc_0/In3] \
  [get_bd_pins sys_concat_intc_0/In2] [get_bd_pins sys_concat_intc_0/In1] [get_bd_pins sys_concat_intc_0/In0] \
  [get_bd_pins sys_ps8/emio_spi0_sclk_i] [get_bd_pins sys_ps8/emio_spi0_s_i] [get_bd_pins sys_ps8/emio_spi1_sclk_i] \
  [get_bd_pins sys_ps8/emio_spi1_s_i]
connect_bd_net [get_bd_pins VCC_1/dout] [get_bd_pins sys_ps8/emio_spi0_ss_i_n] [get_bd_pins sys_ps8/emio_spi1_ss_i_n]
connect_bd_net [get_bd_pins axi_adrv9001/adc_1_clk] [get_bd_pins axi_adrv9001_rx1_dma/fifo_wr_clk] [get_bd_pins util_adc_1_pack/clk]
connect_bd_net [get_bd_pins axi_adrv9001/adc_1_data_i0] [get_bd_pins util_adc_1_pack/fifo_wr_data_0]
connect_bd_net [get_bd_pins axi_adrv9001/adc_1_data_i1] [get_bd_pins util_adc_1_pack/fifo_wr_data_2]
connect_bd_net [get_bd_pins axi_adrv9001/adc_1_data_q0] [get_bd_pins util_adc_1_pack/fifo_wr_data_1]
connect_bd_net [get_bd_pins axi_adrv9001/adc_1_data_q1] [get_bd_pins util_adc_1_pack/fifo_wr_data_3]
connect_bd_net [get_bd_pins axi_adrv9001/adc_1_enable_i0] [get_bd_pins util_adc_1_pack/enable_0]
connect_bd_net [get_bd_pins axi_adrv9001/adc_1_enable_i1] [get_bd_pins util_adc_1_pack/enable_2]
connect_bd_net [get_bd_pins axi_adrv9001/adc_1_enable_q0] [get_bd_pins util_adc_1_pack/enable_1]
connect_bd_net [get_bd_pins axi_adrv9001/adc_1_enable_q1] [get_bd_pins util_adc_1_pack/enable_3]
connect_bd_net [get_bd_pins axi_adrv9001/adc_1_rst] [get_bd_pins util_adc_1_pack/reset]
connect_bd_net [get_bd_pins axi_adrv9001/adc_1_valid_i0] [get_bd_pins util_adc_1_pack/fifo_wr_en]
connect_bd_net [get_bd_pins axi_adrv9001/adc_2_clk] [get_bd_pins axi_adrv9001_rx2_dma/fifo_wr_clk] [get_bd_pins util_adc_2_pack/clk]
connect_bd_net [get_bd_pins axi_adrv9001/adc_2_data_i0] [get_bd_pins util_adc_2_pack/fifo_wr_data_0]
connect_bd_net [get_bd_pins axi_adrv9001/adc_2_data_q0] [get_bd_pins util_adc_2_pack/fifo_wr_data_1]
connect_bd_net [get_bd_pins axi_adrv9001/adc_2_enable_i0] [get_bd_pins util_adc_2_pack/enable_0]
connect_bd_net [get_bd_pins axi_adrv9001/adc_2_enable_q0] [get_bd_pins util_adc_2_pack/enable_1]
connect_bd_net [get_bd_pins axi_adrv9001/adc_2_rst] [get_bd_pins util_adc_2_pack/reset]
connect_bd_net [get_bd_pins axi_adrv9001/adc_2_valid_i0] [get_bd_pins util_adc_2_pack/fifo_wr_en]
connect_bd_net [get_bd_pins axi_adrv9001/dac_1_clk] [get_bd_pins axi_adrv9001_tx1_dma/m_axis_aclk] [get_bd_pins util_dac_1_upack/clk]
connect_bd_net [get_bd_pins axi_adrv9001/dac_1_enable_i0] [get_bd_pins util_dac_1_upack/enable_0]
connect_bd_net [get_bd_pins axi_adrv9001/dac_1_enable_i1] [get_bd_pins util_dac_1_upack/enable_2]
connect_bd_net [get_bd_pins axi_adrv9001/dac_1_enable_q0] [get_bd_pins util_dac_1_upack/enable_1]
connect_bd_net [get_bd_pins axi_adrv9001/dac_1_enable_q1] [get_bd_pins util_dac_1_upack/enable_3]
connect_bd_net [get_bd_pins axi_adrv9001/dac_1_rst] [get_bd_pins util_dac_1_upack/reset]
connect_bd_net [get_bd_pins axi_adrv9001/dac_1_valid_i0] [get_bd_pins util_dac_1_upack/fifo_rd_en]
connect_bd_net [get_bd_pins axi_adrv9001/dac_2_clk] [get_bd_pins axi_adrv9001_tx2_dma/m_axis_aclk] [get_bd_pins util_dac_2_upack/clk]
connect_bd_net [get_bd_pins axi_adrv9001/dac_2_enable_i0] [get_bd_pins util_dac_2_upack/enable_0]
connect_bd_net [get_bd_pins axi_adrv9001/dac_2_enable_q0] [get_bd_pins util_dac_2_upack/enable_1]
connect_bd_net [get_bd_pins axi_adrv9001/dac_2_rst] [get_bd_pins util_dac_2_upack/reset]
connect_bd_net [get_bd_pins axi_adrv9001/dac_2_valid_i0] [get_bd_pins util_dac_2_upack/fifo_rd_en]
connect_bd_net [get_bd_pins axi_adrv9001/mcs_out] [get_bd_ports mcs_out]
connect_bd_net [get_bd_pins axi_adrv9001_rx1_dma/irq] [get_bd_pins sys_concat_intc_1/In5]
connect_bd_net [get_bd_pins axi_adrv9001/rx1_enable] [get_bd_ports rx1_enable]
connect_bd_net [get_bd_pins axi_adrv9001_rx2_dma/irq] [get_bd_pins sys_concat_intc_1/In4]
connect_bd_net [get_bd_pins axi_adrv9001/rx2_enable] [get_bd_ports rx2_enable]
connect_bd_net [get_bd_pins axi_adrv9001/tdd_sync_cntr] [get_bd_ports tdd_sync_cntr]
connect_bd_net [get_bd_pins axi_adrv9001/tx1_dclk_out_n_NC] [get_bd_ports tx1_dclk_out_n]
connect_bd_net [get_bd_pins axi_adrv9001/tx1_dclk_out_p_dclk_out] [get_bd_ports tx1_dclk_out_p]
connect_bd_net [get_bd_pins axi_adrv9001_tx1_dma/irq] [get_bd_pins sys_concat_intc_1/In1]
connect_bd_net [get_bd_pins axi_adrv9001/tx1_enable] [get_bd_ports tx1_enable]
connect_bd_net [get_bd_pins axi_adrv9001/tx1_idata_out_n_idata0] [get_bd_ports tx1_idata_out_n]
connect_bd_net [get_bd_pins axi_adrv9001/tx1_idata_out_p_idata1] [get_bd_ports tx1_idata_out_p]
connect_bd_net [get_bd_pins axi_adrv9001/tx1_qdata_out_n_qdata2] [get_bd_ports tx1_qdata_out_n]
connect_bd_net [get_bd_pins axi_adrv9001/tx1_qdata_out_p_qdata3] [get_bd_ports tx1_qdata_out_p]
connect_bd_net [get_bd_pins axi_adrv9001/tx1_strobe_out_n_NC] [get_bd_ports tx1_strobe_out_n]
connect_bd_net [get_bd_pins axi_adrv9001/tx1_strobe_out_p_strobe_out] [get_bd_ports tx1_strobe_out_p]
connect_bd_net [get_bd_pins axi_adrv9001/tx2_dclk_out_n_NC] [get_bd_ports tx2_dclk_out_n]
connect_bd_net [get_bd_pins axi_adrv9001/tx2_dclk_out_p_dclk_out] [get_bd_ports tx2_dclk_out_p]
connect_bd_net [get_bd_pins axi_adrv9001_tx2_dma/irq] [get_bd_pins sys_concat_intc_1/In2]
connect_bd_net [get_bd_pins axi_adrv9001/tx2_enable] [get_bd_ports tx2_enable]
connect_bd_net [get_bd_pins axi_adrv9001/tx2_idata_out_n_idata0] [get_bd_ports tx2_idata_out_n]
connect_bd_net [get_bd_pins axi_adrv9001/tx2_idata_out_p_idata1] [get_bd_ports tx2_idata_out_p]
connect_bd_net [get_bd_pins axi_adrv9001/tx2_qdata_out_n_qdata2] [get_bd_ports tx2_qdata_out_n]
connect_bd_net [get_bd_pins axi_adrv9001/tx2_qdata_out_p_qdata3] [get_bd_ports tx2_qdata_out_p]
connect_bd_net [get_bd_pins axi_adrv9001/tx2_strobe_out_n_NC] [get_bd_ports tx2_strobe_out_n]
connect_bd_net [get_bd_pins axi_adrv9001/tx2_strobe_out_p_strobe_out] [get_bd_ports tx2_strobe_out_p]
connect_bd_net [get_bd_pins axi_sysid_0/rom_addr] [get_bd_pins rom_sys_0/rom_addr]
connect_bd_net -net axi_t12_aux_gpio_gpio_io_i [get_bd_ports t12_aux_gpio_i] [get_bd_pins axi_t12_aux_gpio/gpio_io_i]
connect_bd_net [get_bd_pins axi_t12_aux_gpio/gpio_io_o] [get_bd_ports t12_aux_gpio_o]
connect_bd_net [get_bd_pins axi_t12_aux_gpio/gpio_io_t] [get_bd_ports t12_aux_gpio_t]
connect_bd_net [get_bd_pins axi_t12_gpio/gpio2_io_o] [get_bd_ports t12_gpio1_o]
connect_bd_net [get_bd_pins axi_t12_gpio/gpio2_io_t] [get_bd_ports t12_gpio1_t]
connect_bd_net [get_bd_pins axi_t12_gpio/gpio_io_o] [get_bd_ports t12_gpio0_o]
connect_bd_net [get_bd_pins axi_t12_gpio/gpio_io_t] [get_bd_ports t12_gpio0_t]
connect_bd_net [get_bd_ports gpio_i] [get_bd_pins sys_ps8/emio_gpio_i]
connect_bd_net [get_bd_ports gpio_rx1_enable_in] [get_bd_pins axi_adrv9001/gpio_rx1_enable_in]
connect_bd_net [get_bd_ports gpio_rx2_enable_in] [get_bd_pins axi_adrv9001/gpio_rx2_enable_in]
connect_bd_net [get_bd_ports gpio_tx1_enable_in] [get_bd_pins axi_adrv9001/gpio_tx1_enable_in]
connect_bd_net [get_bd_ports gpio_tx2_enable_in] [get_bd_pins axi_adrv9001/gpio_tx2_enable_in]
connect_bd_net -net hb_tft_csn [get_bd_pins axi_quad_spi_hb/ss_o] [get_bd_ports hb_tft_csn]
connect_bd_net [get_bd_ports hb_tft_miso] [get_bd_pins axi_quad_spi_hb/io1_i]
connect_bd_net -net hb_tft_mosi [get_bd_pins axi_quad_spi_hb/io0_o] [get_bd_ports hb_tft_mosi]
connect_bd_net -net hb_tft_sclk [get_bd_pins axi_quad_spi_hb/sck_o] [get_bd_ports hb_tft_sclk]
connect_bd_net -net lb_tft_csn [get_bd_pins axi_quad_spi_lb/ss_o] [get_bd_ports lb_tft_csn]
connect_bd_net [get_bd_ports lb_tft_miso] [get_bd_pins axi_quad_spi_lb/io1_i]
connect_bd_net -net lb_tft_mosi [get_bd_pins axi_quad_spi_lb/io0_o] [get_bd_ports lb_tft_mosi]
connect_bd_net -net lb_tft_sclk [get_bd_pins axi_quad_spi_lb/sck_o] [get_bd_ports lb_tft_sclk]
connect_bd_net [get_bd_ports mcs_in] [get_bd_pins axi_adrv9001/mcs_in]
connect_bd_net [get_bd_ports mssi_sync] [get_bd_pins axi_adrv9001/mssi_sync_in]
connect_bd_net -net ref_clk_1 [get_bd_ports fpga_ref_clk] [get_bd_pins axi_adrv9001/ref_clk]
connect_bd_net [get_bd_pins rom_sys_0/rom_data] [get_bd_pins axi_sysid_0/sys_rom_data]
connect_bd_net [get_bd_ports rx1_dclk_in_n] [get_bd_pins axi_adrv9001/rx1_dclk_in_n_NC]
connect_bd_net [get_bd_ports rx1_dclk_in_p] [get_bd_pins axi_adrv9001/rx1_dclk_in_p_dclk_in]
connect_bd_net [get_bd_ports rx1_idata_in_n] [get_bd_pins axi_adrv9001/rx1_idata_in_n_idata0]
connect_bd_net [get_bd_ports rx1_idata_in_p] [get_bd_pins axi_adrv9001/rx1_idata_in_p_idata1]
connect_bd_net [get_bd_ports rx1_qdata_in_n] [get_bd_pins axi_adrv9001/rx1_qdata_in_n_qdata2]
connect_bd_net [get_bd_ports rx1_qdata_in_p] [get_bd_pins axi_adrv9001/rx1_qdata_in_p_qdata3]
connect_bd_net [get_bd_ports rx1_strobe_in_n] [get_bd_pins axi_adrv9001/rx1_strobe_in_n_NC]
connect_bd_net [get_bd_ports rx1_strobe_in_p] [get_bd_pins axi_adrv9001/rx1_strobe_in_p_strobe_in]
connect_bd_net [get_bd_ports rx2_dclk_in_n] [get_bd_pins axi_adrv9001/rx2_dclk_in_n_NC]
connect_bd_net [get_bd_ports rx2_dclk_in_p] [get_bd_pins axi_adrv9001/rx2_dclk_in_p_dclk_in]
connect_bd_net [get_bd_ports rx2_idata_in_n] [get_bd_pins axi_adrv9001/rx2_idata_in_n_idata0]
connect_bd_net [get_bd_ports rx2_idata_in_p] [get_bd_pins axi_adrv9001/rx2_idata_in_p_idata1]
connect_bd_net [get_bd_ports rx2_qdata_in_n] [get_bd_pins axi_adrv9001/rx2_qdata_in_n_qdata2]
connect_bd_net [get_bd_ports rx2_qdata_in_p] [get_bd_pins axi_adrv9001/rx2_qdata_in_p_qdata3]
connect_bd_net [get_bd_ports rx2_strobe_in_n] [get_bd_pins axi_adrv9001/rx2_strobe_in_n_NC]
connect_bd_net [get_bd_ports rx2_strobe_in_p] [get_bd_pins axi_adrv9001/rx2_strobe_in_p_strobe_in]
connect_bd_net [get_bd_pins spi0_csn_concat/dout] [get_bd_ports spi0_csn]
connect_bd_net -net spi0_miso_1 [get_bd_ports spi_do] [get_bd_pins sys_ps8/emio_spi0_m_i]
connect_bd_net [get_bd_pins spi1_csn_concat/dout] [get_bd_ports spi1_csn]
connect_bd_net -net spi1_miso_1 [get_bd_ports dcosc_miso] [get_bd_pins sys_ps8/emio_spi1_m_i]
connect_bd_net -net sys_500m_clk [get_bd_pins sys_ps8/pl_clk2] [get_bd_pins axi_adrv9001/delay_clk]
connect_bd_net [get_bd_pins sys_concat_intc_0/dout] [get_bd_pins sys_ps8/pl_ps_irq0]
connect_bd_net [get_bd_pins sys_concat_intc_1/dout] [get_bd_pins sys_ps8/pl_ps_irq1]
connect_bd_net -net sys_cpu_clk [get_bd_pins sys_ps8/pl_clk0] \
  [get_bd_pins axi_adrv9001/s_axi_aclk] [get_bd_pins axi_adrv9001_rx1_dma/s_axi_aclk] \
  [get_bd_pins axi_adrv9001_rx1_dma/m_dest_axi_aclk] [get_bd_pins axi_adrv9001_rx2_dma/s_axi_aclk] \
  [get_bd_pins axi_adrv9001_rx2_dma/m_dest_axi_aclk] [get_bd_pins axi_adrv9001_tx1_dma/s_axi_aclk] \
  [get_bd_pins axi_adrv9001_tx1_dma/m_src_axi_aclk] [get_bd_pins axi_adrv9001_tx2_dma/s_axi_aclk] \
  [get_bd_pins axi_adrv9001_tx2_dma/m_src_axi_aclk] [get_bd_pins axi_hpc0_interconnect/aclk] \
  [get_bd_pins axi_hpm0_lpd_interconnect/aclk] [get_bd_pins axi_sysid_0/s_axi_aclk] [get_bd_pins rom_sys_0/clk] \
  [get_bd_pins sys_ps8/maxihpm0_lpd_aclk] [get_bd_pins sys_ps8/saxihpc0_fpd_aclk] [get_bd_pins sys_rstgen/slowest_sync_clk] \
  [get_bd_pins axi_t12_gpio/s_axi_aclk] [get_bd_pins axi_t12_aux_gpio/s_axi_aclk] [get_bd_pins axi_quad_spi_lb/s_axi_aclk] \
  [get_bd_pins axi_quad_spi_lb/ext_spi_clk] [get_bd_pins axi_quad_spi_hb/s_axi_aclk] \
  [get_bd_pins axi_quad_spi_hb/ext_spi_clk]
# net sys_cpu_reset has one end: sys_rstgen/peripheral_reset
connect_bd_net -net sys_cpu_resetn [get_bd_pins sys_rstgen/peripheral_aresetn] \
  [get_bd_pins axi_adrv9001/s_axi_aresetn] [get_bd_pins axi_adrv9001_rx1_dma/s_axi_aresetn] \
  [get_bd_pins axi_adrv9001_rx1_dma/m_dest_axi_aresetn] [get_bd_pins axi_adrv9001_rx2_dma/s_axi_aresetn] \
  [get_bd_pins axi_adrv9001_rx2_dma/m_dest_axi_aresetn] [get_bd_pins axi_adrv9001_tx1_dma/s_axi_aresetn] \
  [get_bd_pins axi_adrv9001_tx1_dma/m_src_axi_aresetn] [get_bd_pins axi_adrv9001_tx2_dma/s_axi_aresetn] \
  [get_bd_pins axi_adrv9001_tx2_dma/m_src_axi_aresetn] [get_bd_pins axi_hpc0_interconnect/aresetn] \
  [get_bd_pins axi_hpm0_lpd_interconnect/aresetn] [get_bd_pins axi_sysid_0/s_axi_aresetn] \
  [get_bd_pins axi_t12_gpio/s_axi_aresetn] [get_bd_pins axi_t12_aux_gpio/s_axi_aresetn] \
  [get_bd_pins axi_quad_spi_lb/s_axi_aresetn] [get_bd_pins axi_quad_spi_hb/s_axi_aresetn]
connect_bd_net [get_bd_pins sys_ps8/emio_gpio_o] [get_bd_ports gpio_o]
connect_bd_net [get_bd_pins sys_ps8/emio_gpio_t] [get_bd_ports gpio_t]
connect_bd_net [get_bd_pins sys_ps8/emio_spi0_m_o] [get_bd_ports spi_dio]
connect_bd_net [get_bd_pins sys_ps8/emio_spi0_sclk_o] [get_bd_ports spi_clk]
connect_bd_net [get_bd_pins sys_ps8/emio_spi0_ss1_o_n] [get_bd_pins spi0_csn_concat/In1]
connect_bd_net [get_bd_pins sys_ps8/emio_spi0_ss2_o_n] [get_bd_pins spi0_csn_concat/In2]
connect_bd_net [get_bd_pins sys_ps8/emio_spi0_ss_o_n] [get_bd_pins spi0_csn_concat/In0]
connect_bd_net [get_bd_pins sys_ps8/emio_spi1_m_o] [get_bd_ports dcosc_mosi]
connect_bd_net [get_bd_pins sys_ps8/emio_spi1_sclk_o] [get_bd_ports dcosc_sclk]
connect_bd_net [get_bd_pins sys_ps8/emio_spi1_ss1_o_n] [get_bd_pins spi1_csn_concat/In1]
connect_bd_net [get_bd_pins sys_ps8/emio_spi1_ss2_o_n] [get_bd_pins spi1_csn_concat/In2]
connect_bd_net [get_bd_pins sys_ps8/emio_spi1_ss_o_n] [get_bd_pins spi1_csn_concat/In0]
connect_bd_net [get_bd_pins sys_ps8/pl_resetn0] [get_bd_pins sys_rstgen/ext_reset_in]
connect_bd_net [get_bd_ports t12_gpio0_i] [get_bd_pins axi_t12_gpio/gpio_io_i]
connect_bd_net [get_bd_ports t12_gpio1_i] [get_bd_pins axi_t12_gpio/gpio2_io_i]
connect_bd_net [get_bd_ports tdd_sync] [get_bd_pins axi_adrv9001/tdd_sync]
connect_bd_net [get_bd_ports tx1_dclk_in_n] [get_bd_pins axi_adrv9001/tx1_dclk_in_n_NC]
connect_bd_net [get_bd_ports tx1_dclk_in_p] [get_bd_pins axi_adrv9001/tx1_dclk_in_p_dclk_in]
connect_bd_net [get_bd_ports tx2_dclk_in_n] [get_bd_pins axi_adrv9001/tx2_dclk_in_n_NC]
connect_bd_net [get_bd_ports tx2_dclk_in_p] [get_bd_pins axi_adrv9001/tx2_dclk_in_p_dclk_in]
connect_bd_net [get_bd_ports tx_output_enable] [get_bd_pins axi_adrv9001/tx_output_enable]
connect_bd_net [get_bd_pins util_adc_1_pack/fifo_wr_overflow] [get_bd_pins axi_adrv9001/adc_1_dovf]
connect_bd_net [get_bd_pins util_adc_1_pack/packed_sync] [get_bd_pins axi_adrv9001_rx1_dma/sync]
connect_bd_net [get_bd_pins util_adc_2_pack/fifo_wr_overflow] [get_bd_pins axi_adrv9001/adc_2_dovf]
connect_bd_net [get_bd_pins util_adc_2_pack/packed_sync] [get_bd_pins axi_adrv9001_rx2_dma/sync]
connect_bd_net [get_bd_pins util_dac_1_upack/fifo_rd_data_0] [get_bd_pins axi_adrv9001/dac_1_data_i0]
connect_bd_net [get_bd_pins util_dac_1_upack/fifo_rd_data_1] [get_bd_pins axi_adrv9001/dac_1_data_q0]
connect_bd_net [get_bd_pins util_dac_1_upack/fifo_rd_data_2] [get_bd_pins axi_adrv9001/dac_1_data_i1]
connect_bd_net [get_bd_pins util_dac_1_upack/fifo_rd_data_3] [get_bd_pins axi_adrv9001/dac_1_data_q1]
connect_bd_net [get_bd_pins util_dac_1_upack/fifo_rd_underflow] [get_bd_pins axi_adrv9001/dac_1_dunf]
connect_bd_net [get_bd_pins util_dac_2_upack/fifo_rd_data_0] [get_bd_pins axi_adrv9001/dac_2_data_i0]
connect_bd_net [get_bd_pins util_dac_2_upack/fifo_rd_data_1] [get_bd_pins axi_adrv9001/dac_2_data_q0]
connect_bd_net [get_bd_pins util_dac_2_upack/fifo_rd_underflow] [get_bd_pins axi_adrv9001/dac_2_dunf]

# ---- address map ----
assign_bd_address -offset 0x00000000 -range 2G -target_address_space [get_bd_addr_spaces axi_adrv9001_rx1_dma/m_dest_axi] [get_bd_addr_segs sys_ps8/SAXIGP0/HPC0_DDR_LOW]
assign_bd_address -offset 0x00000000 -range 2G -target_address_space [get_bd_addr_spaces axi_adrv9001_rx2_dma/m_dest_axi] [get_bd_addr_segs sys_ps8/SAXIGP0/HPC0_DDR_LOW]
assign_bd_address -offset 0x00000000 -range 2G -target_address_space [get_bd_addr_spaces axi_adrv9001_tx1_dma/m_src_axi] [get_bd_addr_segs sys_ps8/SAXIGP0/HPC0_DDR_LOW]
assign_bd_address -offset 0x00000000 -range 2G -target_address_space [get_bd_addr_spaces axi_adrv9001_tx2_dma/m_src_axi] [get_bd_addr_segs sys_ps8/SAXIGP0/HPC0_DDR_LOW]
assign_bd_address -offset 0x0081200000 -range 4K -target_address_space [get_bd_addr_spaces sys_ps8/Data] [get_bd_addr_segs axi_t12_gpio/S_AXI/Reg]
assign_bd_address -offset 0x0081210000 -range 4K -target_address_space [get_bd_addr_spaces sys_ps8/Data] [get_bd_addr_segs axi_quad_spi_lb/AXI_LITE/Reg]
assign_bd_address -offset 0x0081220000 -range 4K -target_address_space [get_bd_addr_spaces sys_ps8/Data] [get_bd_addr_segs axi_quad_spi_hb/AXI_LITE/Reg]
assign_bd_address -offset 0x0081230000 -range 4K -target_address_space [get_bd_addr_spaces sys_ps8/Data] [get_bd_addr_segs axi_t12_aux_gpio/S_AXI/Reg]
assign_bd_address -offset 0x0084A00000 -range 64K -target_address_space [get_bd_addr_spaces sys_ps8/Data] [get_bd_addr_segs axi_adrv9001/s_axi/axi_lite]
assign_bd_address -offset 0x0084A30000 -range 4K -target_address_space [get_bd_addr_spaces sys_ps8/Data] [get_bd_addr_segs axi_adrv9001_rx1_dma/s_axi/axi_lite]
assign_bd_address -offset 0x0084A40000 -range 4K -target_address_space [get_bd_addr_spaces sys_ps8/Data] [get_bd_addr_segs axi_adrv9001_rx2_dma/s_axi/axi_lite]
assign_bd_address -offset 0x0084A50000 -range 4K -target_address_space [get_bd_addr_spaces sys_ps8/Data] [get_bd_addr_segs axi_adrv9001_tx1_dma/s_axi/axi_lite]
assign_bd_address -offset 0x0084A60000 -range 4K -target_address_space [get_bd_addr_spaces sys_ps8/Data] [get_bd_addr_segs axi_adrv9001_tx2_dma/s_axi/axi_lite]
assign_bd_address -offset 0x0085000000 -range 64K -target_address_space [get_bd_addr_spaces sys_ps8/Data] [get_bd_addr_segs axi_sysid_0/s_axi/axi_lite]

validate_bd_design
save_bd_design
